# Altium schematic sheet STM32Clone1_12.STM32_Blue_Pill_Clone.schdoc
size 289 x 200 mm; Name: default297x210; Symbol: default297x210; Device: default297x210; Size: "A4"; Id: /; File: 12.STM32 Blue Pill Clone; Sheet: /; SheetNumber: 16; SheetTotal: 17
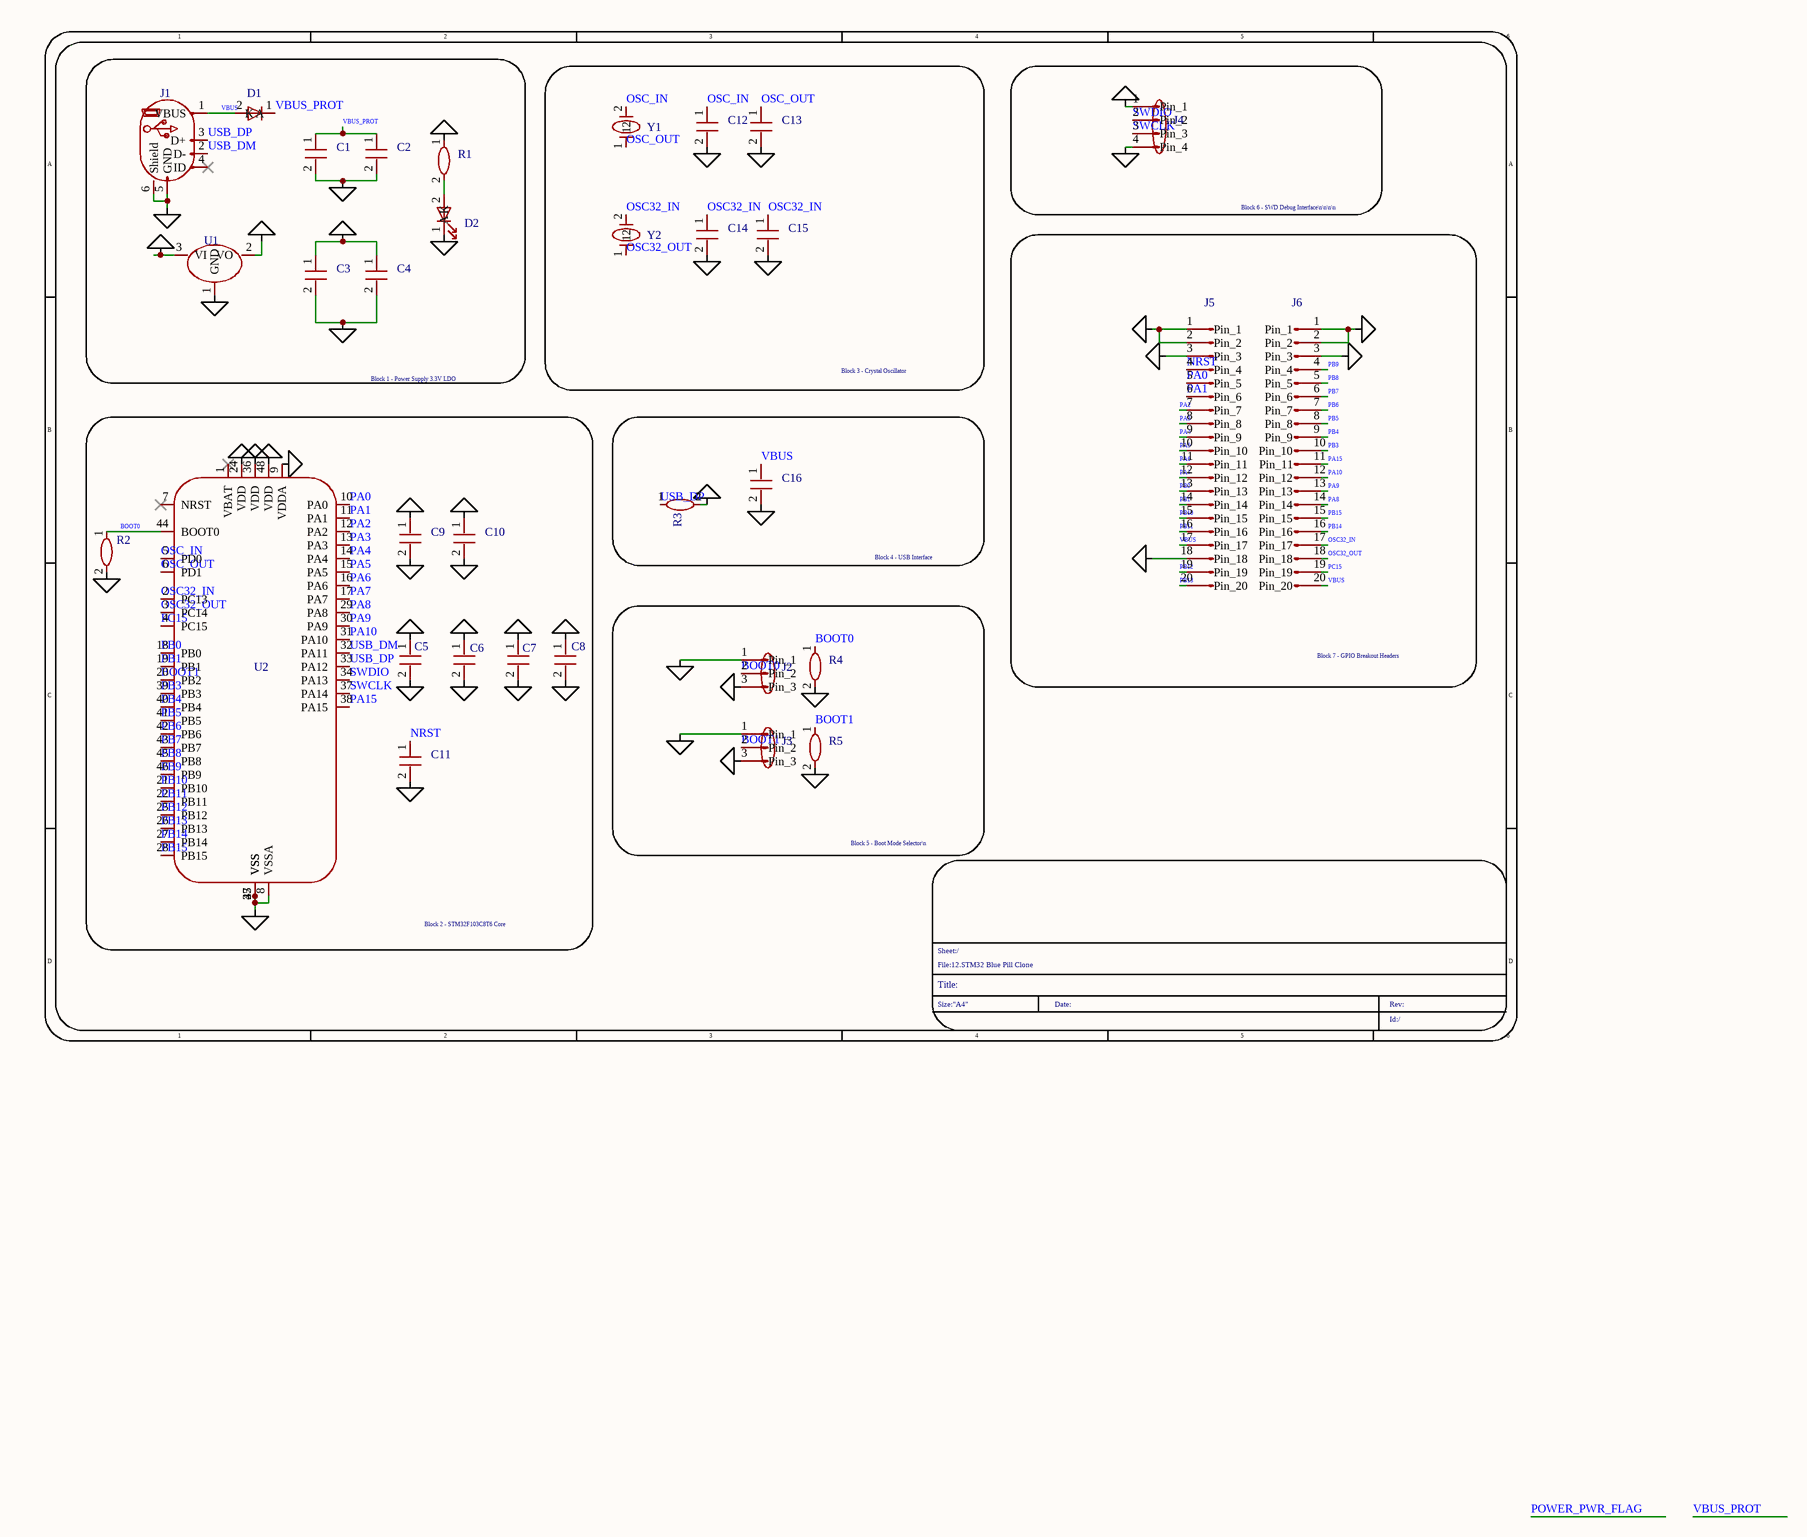
[diagram p0: STM32Clone1_12.STM32_Blue_Pill_Clone.schdoc]

## Parts
C1  Device_C  (value not drawn)
C2  Device_C  (value not drawn)
C3  Device_C  (value not drawn)
C4  Device_C  (value not drawn)
C5  Device_C  (value not drawn)
C6  Device_C  (value not drawn)
C7  Device_C  (value not drawn)
C8  Device_C  (value not drawn)
C9  Device_C  (value not drawn)
C10  Device_C  (value not drawn)
C11  Device_C  (value not drawn)
C12  Device_C  (value not drawn)
C13  Device_C  (value not drawn)
C14  Device_C  (value not drawn)
C15  Device_C  (value not drawn)
C16  Device_C  (value not drawn)
D1  Device_D  (value not drawn)
D2  Device_LED  (value not drawn)
J1  Connector_USB_B_Micro  (value not drawn)
J2  Connector_Generic_Conn_01x03  (value not drawn)
J3  Connector_Generic_Conn_01x03  (value not drawn)
J4  Connector_Generic_Conn_01x04  (value not drawn)
J5  Connector_Conn_01x20_Pin  (value not drawn)
J6  Connector_Conn_01x20_Pin  (value not drawn)
R1  Device_R  (value not drawn)
R2  Device_R  (value not drawn)
R3  Device_R  (value not drawn)
R4  Device_R  (value not drawn)
R5  Device_R  (value not drawn)
U1  Regulator_Linear_AMS1117-3.3  (value not drawn)
U2  MCU_ST_STM32F1_STM32F103C8Tx  (value not drawn)
Y1  Device_Crystal  (value not drawn)
Y2  Device_Crystal  (value not drawn)

## Blocks framed on the sheet
Block 1 - Power Supply 3.3V LDO: C1-C4 D1 D2 J1 R1 U1
Block 3 - Crystal Oscillator: C12-C15 Y1 Y2
Block 6 - SWD Debug Interface\n\n\n\n: J4
Block 7 - GPIO Breakout Headers: J5 J6
Block 2 - STM32F103C8T6 Core: C5-C11 R2 U2
Block 4 - USB Interface: C16 R3
Block 5 - Boot Mode Selector\n: J2 J3 R4 R5

## Nets
POWER_+3V3: C3.1 C4.1 C5.1 C6.1 C7.1 C8.1 C9.1 C10.1 J2.3(Pin_3) J3.3(Pin_3) J4.1(Pin_1) J5.3(Pin_3) J6.3(Pin_3) R1.1 R3.2 U1.2(VO) U2.9(VDDA) U2.24(VDD) U2.36(VDD) U2.48(VDD)
POWER_GND: C1.2 C2.2 C3.2 C4.2 C5.2 C6.2 C7.2 C8.2 C9.2 C10.2 C11.2 C12.2 C13.2 C14.2 C15.2 C16.2 D2.1(K) J1.5(GND) J1.6(Shield) J2.1(Pin_1) J3.1(Pin_1) J4.4(Pin_4) J5.1(Pin_1) J5.2(Pin_2) J5.18(Pin_18) J6.1(Pin_1) J6.2(Pin_2) R2.2 R4.2 R5.2 U1.1(GND) U2.8(VSSA) U2.23(VSS) U2.35(VSS) U2.47(VSS)
POWER_PWR_FLAG: U1.3(VI)
BOOT0: J2.2(Pin_2) R2.1 R4.1 U2.44(BOOT0)
BOOT1: J3.2(Pin_2) R5.1 U2.20(PB2)
NRST: C11.1 J5.4(Pin_4)
OSC32_IN: C14.1 C15.1 J6.17(Pin_17) U2.2(PC13) Y2.2
OSC32_OUT: J6.18(Pin_18) U2.3(PC14) Y2.1
OSC_IN: C12.1 U2.5(PD0) Y1.2
OSC_OUT: C13.1 U2.6(PD1) Y1.1
PA0: J5.5(Pin_5) U2.10(PA0)
PA1: J5.6(Pin_6) U2.11(PA1)
PA2: J5.7(Pin_7) U2.12(PA2)
PA3: J5.8(Pin_8) U2.13(PA3)
PA4: J5.9(Pin_9) U2.14(PA4)
PA5: J5.10(Pin_10) U2.15(PA5)
PA6: J5.11(Pin_11) U2.16(PA6)
PA7: J5.12(Pin_12) U2.17(PA7)
PA8: J6.14(Pin_14) U2.29(PA8)
PA9: J6.13(Pin_13) U2.30(PA9)
PA10: J6.12(Pin_12) U2.31(PA10)
PA15: J6.11(Pin_11) U2.38(PA15)
PB0: J5.13(Pin_13) U2.18(PB0)
PB1: J5.14(Pin_14) U2.19(PB1)
PB3: J6.10(Pin_10) U2.39(PB3)
PB4: J6.9(Pin_9) U2.40(PB4)
PB5: J6.8(Pin_8) U2.41(PB5)
PB6: J6.7(Pin_7) U2.42(PB6)
PB7: J6.6(Pin_6) U2.43(PB7)
PB8: J6.5(Pin_5) U2.45(PB8)
PB9: J6.4(Pin_4) U2.46(PB9)
PB10: J5.15(Pin_15) U2.21(PB10)
PB11: J5.16(Pin_16) U2.22(PB11)
PB12: J5.19(Pin_19) U2.25(PB12)
PB13: J5.20(Pin_20) U2.26(PB13)
PB14: J6.16(Pin_16) U2.27(PB14)
PB15: J6.15(Pin_15) U2.28(PB15)
PC15: J6.19(Pin_19) U2.4(PC15)
SWCLK: J4.3(Pin_3) U2.37(PA14)
SWDIO: J4.2(Pin_2) U2.34(PA13)
USB_DM: J1.2(D-) U2.32(PA11)
USB_DP: J1.3(D+) R3.1 U2.33(PA12)
VBUS: C16.1 D1.2(A) J1.1(VBUS) J5.17(Pin_17) J6.20(Pin_20)
VBUS_PROT: C1.1 C2.1 D1.1(K)
NetD2_2: D2.2(A) R1.2

Not connected (* = marked no-connect by the designer): J1 4(ID)*; U2 1(VBAT)* 7(NRST)*

## Notes on the sheet
- 1
- 2
- 3
- 4
- 5
- 6
- A
- B
- C
- D
- File:12.STM32 Blue Pill Clone
- Sheet:/
- Size:"A4"
- Title:
- Date:
- Rev:
- Id:/

## Library data of the parts
C1 C3 = Device_C: Value: 10uF; Add into BOM: yes; Origin Footprint: Capacitor_SMD:C_0805_2012Metric; Symbol: Device_C; Device: Device_C; User doc link: ~; Convert to PCB: yes
C2 C4 C16 = Device_C: Value: 100nF; Add into BOM: yes; Origin Footprint: Capacitor_SMD:C_0402_1005Metric; Symbol: Device_C; Device: Device_C; User doc link: ~; Convert to PCB: yes
C5-C9 = Device_C: Value: 100nf; Add into BOM: yes; Origin Footprint: Capacitor_SMD:C_0402_1005Metric; Symbol: Device_C; Device: Device_C; User doc link: ~; Convert to PCB: yes
C10 C11 = Device_C: Value: 1uf; Add into BOM: yes; Origin Footprint: Capacitor_SMD:C_0402_1005Metric; Symbol: Device_C; Device: Device_C; User doc link: ~; Convert to PCB: yes
C12 C13 = Device_C: Value: 20PF; Add into BOM: yes; Origin Footprint: Capacitor_SMD:C_0402_1005Metric; Symbol: Device_C; Device: Device_C; User doc link: ~; Convert to PCB: yes
C14 C15 = Device_C: Value: 12.5pF; Add into BOM: yes; Origin Footprint: Capacitor_SMD:C_0402_1005Metric; Symbol: Device_C; Device: Device_C; User doc link: ~; Convert to PCB: yes
D1 = Device_D: Value: 1N5819; Sim_Device: D; Sim_Pins: 1=K 2=A; Add into BOM: yes; Origin Footprint: Diode_SMD:D_SOD-123; Symbol: Device_D; Device: Device_D; User doc link: ~; Convert to PCB: yes; Sim.Device: D; Sim.Pins: 1=K 2=A
D2 = Device_LED: Value: PWR_LED; Sim_Pins: 1=K 2=A; Add into BOM: yes; Origin Footprint: LED_SMD:LED_0805_2012Metric; Symbol: Device_LED; Device: Device_LED; User doc link: ~; Convert to PCB: yes; Sim.Pins: 1=K 2=A
J1 = Connector_USB_B_Micro: Add into BOM: yes; Origin Footprint: Connector_USB:USB_Micro-B_Amphenol_10118194_Horizontal; Symbol: Connector_USB_B_Micro; Device: Connector_USB_B_Micro; Value: USB_B_Micro; User doc link: ~; Convert to PCB: yes
J2 = Connector_Generic_Conn_01x03: Value: BOOT0_SEL; Add into BOM: yes; Origin Footprint: Connector_PinHeader_2.54mm:PinHeader_1x03_P2.54mm_Vertical; Symbol: Connector_Generic_Conn_01x03; Device: Connector_Generic_Conn_01x03; User doc link: ~; Convert to PCB: yes
J3 = Connector_Generic_Conn_01x03: Value: BOOT1_SEL; Add into BOM: yes; Origin Footprint: Connector_PinHeader_2.54mm:PinHeader_1x03_P2.54mm_Vertical; Symbol: Connector_Generic_Conn_01x03; Device: Connector_Generic_Conn_01x03; User doc link: ~; Convert to PCB: yes
J4 = Connector_Generic_Conn_01x04: Value: SWD; Add into BOM: yes; Origin Footprint: Connector_PinHeader_2.54mm:PinHeader_1x03_P2.54mm_Vertical; Symbol: Connector_Generic_Conn_01x04; Device: Connector_Generic_Conn_01x04; User doc link: ~; Convert to PCB: yes
J5 = Connector_Conn_01x20_Pin: Value: LEFT_HEADER; Add into BOM: yes; Origin Footprint: Connector_PinHeader_2.54mm:PinHeader_1x03_P2.54mm_Vertical; Symbol: Connector_Conn_01x20_Pin; Device: Connector_Conn_01x20_Pin; User doc link: ~; Convert to PCB: yes
J6 = Connector_Conn_01x20_Pin: Value: RIGHT_HEADER; Add into BOM: yes; Origin Footprint: Connector_PinHeader_2.54mm:PinHeader_1x03_P2.54mm_Vertical; Symbol: Connector_Conn_01x20_Pin; Device: Connector_Conn_01x20_Pin; User doc link: ~; Convert to PCB: yes
R1 = Device_R: Value: 1k; Add into BOM: yes; Origin Footprint: Resistor_SMD:R_0402_1005Metric; Symbol: Device_R; Device: Device_R; User doc link: ~; Convert to PCB: yes
R2 R4 R5 = Device_R: Value: 10k; Add into BOM: yes; Origin Footprint: Resistor_SMD:R_0402_1005Metric; Symbol: Device_R; Device: Device_R; User doc link: ~; Convert to PCB: yes
R3 = Device_R: Value: 1.5K; Add into BOM: yes; Origin Footprint: Resistor_SMD:R_0402_1005Metric; Symbol: Device_R; Device: Device_R; User doc link: ~; Convert to PCB: yes
U1 = Regulator_Linear_AMS1117-3.3: Add into BOM: yes; Origin Footprint: Package_TO_SOT_SMD:SOT-223-3_TabPin2; Symbol: Regulator_Linear_AMS1117-3.3; Device: Regulator_Linear_AMS1117-3.3; Value: AMS1117-3.3; User doc link: http://www.advanced-monolithic.com/pdf/ds1117.pdf; Convert to PCB: yes
U2 = MCU_ST_STM32F1_STM32F103C8Tx: Value: STM32F103C8T6; Add into BOM: yes; Origin Footprint: Package_QFP:LQFP-48_7x7mm_P0.5mm; Symbol: MCU_ST_STM32F1_STM32F103C8Tx; Device: MCU_ST_STM32F1_STM32F103C8Tx; User doc link: https://www.st.com/resource/en/datasheet/stm32f103c8.pdf; Convert to PCB: yes
Y1 = Device_Crystal: Value: 8MHz; Add into BOM: yes; Origin Footprint: Crystal:Crystal_SMD_3225-4Pin_3.2x2.5mm; Symbol: Device_Crystal; Device: Device_Crystal; User doc link: ~; Convert to PCB: yes
Y2 = Device_Crystal: Value: 32.768kHz; Add into BOM: yes; Origin Footprint: Crystal:Crystal_SMD_3215-2Pin_3.2x1.5mm; Symbol: Device_Crystal; Device: Device_Crystal; User doc link: ~; Convert to PCB: yes